# Altium project RAD_v3 Interposer.PrjPcb
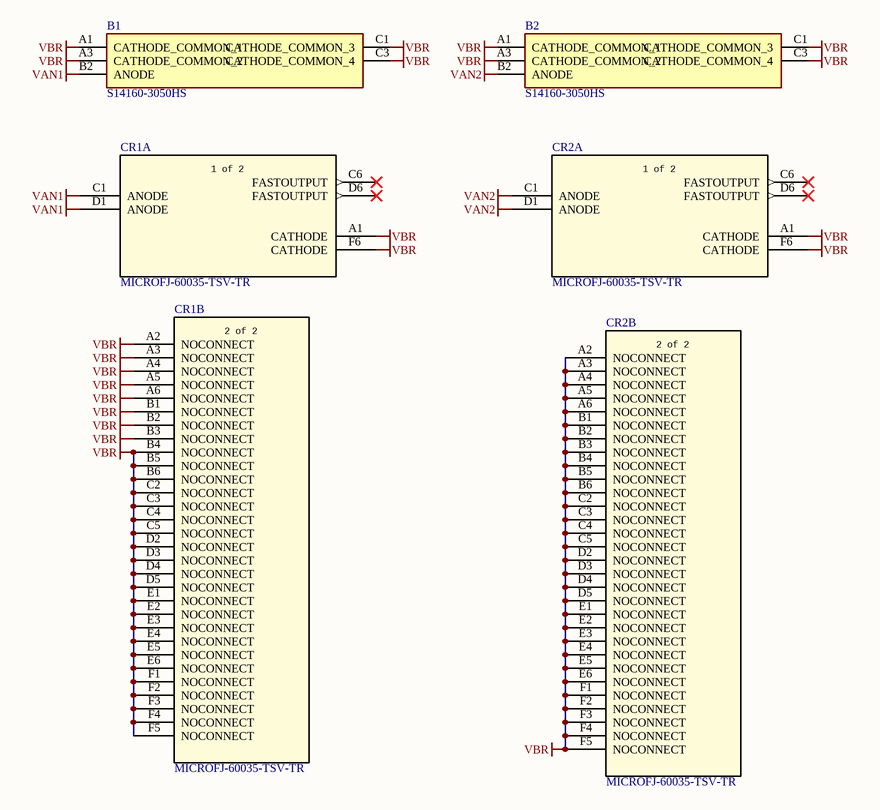
[diagram p0: Rad_v3 Interposer.SchDoc]
1 sheet, 4 parts. Net scope: global (net labels, ports and power ports of the same name join across sheets).
Board file: Rad_v3 Interposer.PcbDoc

## Sheet Rad_v3 Interposer.SchDoc
size A4; SheetNumber: 1; SheetTotal: 1

### Parts
B1  S14160-3050HS  [S141603050HS]
B2  S14160-3050HS  [S141603050HS]
CR1  MICROFJ-60035-TSV-TR  [MicroFJ-60035-TSV_OSI]  (parts A,B of 2)
CR2  MICROFJ-60035-TSV-TR  [MicroFJ-60035-TSV_OSI]  (parts A,B of 2)

### Nets
VAN1: B1.B2(ANODE) CR1.C1(ANODE) CR1.D1(ANODE)
VAN2: B2.B2(ANODE) CR2.C1(ANODE) CR2.D1(ANODE)
VBR: B1.A1(CATHODE_COMMON_1) B1.A3(CATHODE_COMMON_2) B1.C1(CATHODE_COMMON_3) B1.C3(CATHODE_COMMON_4) B2.A1(CATHODE_COMMON_1) B2.A3(CATHODE_COMMON_2) B2.C1(CATHODE_COMMON_3) B2.C3(CATHODE_COMMON_4) CR1.A1(CATHODE) CR1.A2(NOCONNECT) CR1.A3(NOCONNECT) CR1.A4(NOCONNECT) CR1.A5(NOCONNECT) CR1.A6(NOCONNECT) CR1.B1(NOCONNECT) CR1.B2(NOCONNECT) CR1.B3(NOCONNECT) CR1.B4(NOCONNECT) CR1.B5(NOCONNECT) CR1.B6(NOCONNECT) CR1.C2(NOCONNECT) CR1.C3(NOCONNECT) CR1.C4(NOCONNECT) CR1.C5(NOCONNECT) CR1.D2(NOCONNECT) CR1.D3(NOCONNECT) CR1.D4(NOCONNECT) CR1.D5(NOCONNECT) CR1.E1(NOCONNECT) CR1.E2(NOCONNECT) CR1.E3(NOCONNECT) CR1.E4(NOCONNECT) CR1.E5(NOCONNECT) CR1.E6(NOCONNECT) CR1.F1(NOCONNECT) CR1.F2(NOCONNECT) CR1.F3(NOCONNECT) CR1.F4(NOCONNECT) CR1.F5(NOCONNECT) CR1.F6(CATHODE) CR2.A1(CATHODE) CR2.A2(NOCONNECT) CR2.A3(NOCONNECT) CR2.A4(NOCONNECT) CR2.A5(NOCONNECT) CR2.A6(NOCONNECT) CR2.B1(NOCONNECT) CR2.B2(NOCONNECT) CR2.B3(NOCONNECT) CR2.B4(NOCONNECT) CR2.B5(NOCONNECT) CR2.B6(NOCONNECT) CR2.C2(NOCONNECT) CR2.C3(NOCONNECT) CR2.C4(NOCONNECT) CR2.C5(NOCONNECT) CR2.D2(NOCONNECT) CR2.D3(NOCONNECT) CR2.D4(NOCONNECT) CR2.D5(NOCONNECT) CR2.E1(NOCONNECT) CR2.E2(NOCONNECT) CR2.E3(NOCONNECT) CR2.E4(NOCONNECT) CR2.E5(NOCONNECT) CR2.E6(NOCONNECT) CR2.F1(NOCONNECT) CR2.F2(NOCONNECT) CR2.F3(NOCONNECT) CR2.F4(NOCONNECT) CR2.F5(NOCONNECT) CR2.F6(CATHODE)

Not connected (* = marked no-connect by the designer): CR1 C6(FASTOUTPUT)* D6(FASTOUTPUT)*; CR2 C6(FASTOUTPUT)* D6(FASTOUTPUT)*

### Notes on the sheet
- (in symbol MICROFJ-60035-TSV-TR, part A) 1 of 2
- (in symbol MICROFJ-60035-TSV-TR, part B) 2 of 2

### Library data of the parts
B1 B2 = S14160-3050HS: The S14160 series achieve higher PDE (photon detection efficiency) and lower operation voltage than other MPPC to adapt for PET and radiation monitor application.-Higher PDE: 50% at p, Vop=VBR + 2.7 V; Manufacturer_Name: Hamamatsu; Geometry.Height: 1.55mm; Manufacturer_Part_Number: S14160-3050HS; Mouser Part Number: *; Mouser Price/Stock: *; Arrow Part Number: *; Arrow Price/Stock: *; Datasheet Link: https://www.hamamatsu.com/content/dam/hamamatsu-photonics/sites/documents/99_SALES_LIBRARY/ssd/s14160_s14161_series_kapd1064e.pdf
CR1 CR2 = MICROFJ-60035-TSV-TR: Description; Manufacturer_Name: onsemi; Copyright: Copyright (C) 2026 Ultra Librarian. All rights reserved.; Manufacturer_Part_Number: MICROFJ-60035-TSV-TR; RefDes: RefDes; Type: Type